# EasyEDA Pro project ProPrj_trevorschirmer-relayboard_2025-04-09.epro, board PCB_3
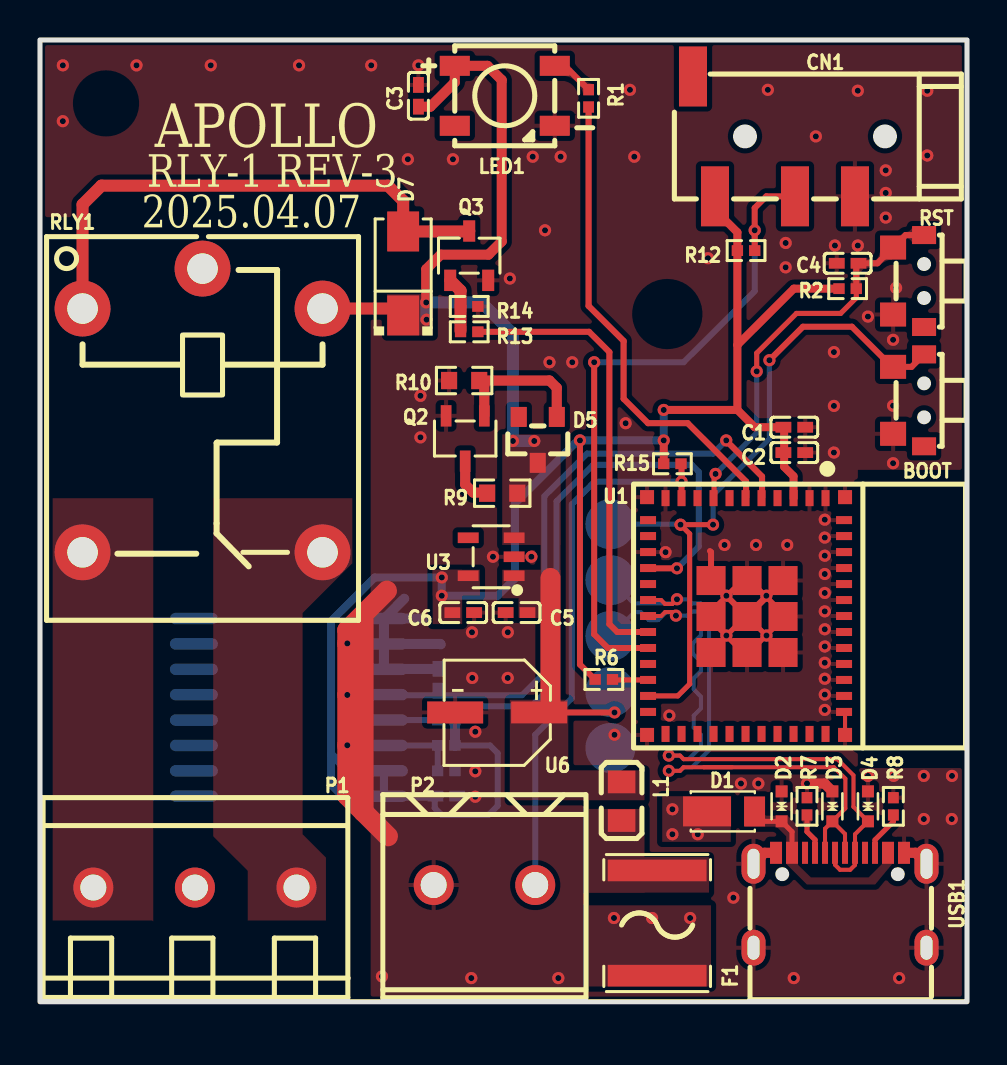
[diagram p8: board, top side]
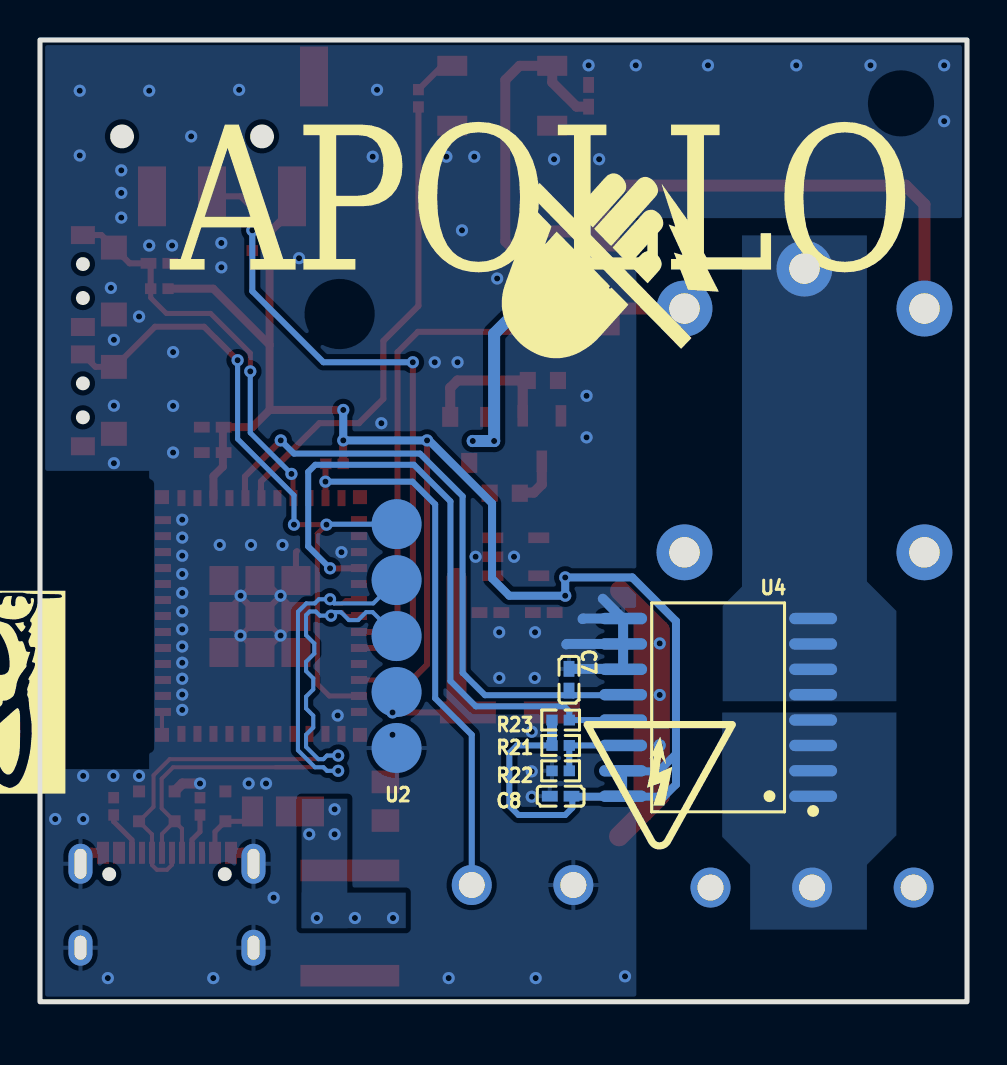
[diagram p9: board, bottom side, seen from below]

Outline 46.36 x 48.13 mm; copper layers: Top Layer, Bottom Layer. Coordinates in mm from the lower left corner of the outline.
Outline path: rectangle 0,48.13 46.36,0
Stack: Top Layer 0.07mm / Dielectric1 1.44mm FR4 er 4.5 / Bottom Layer 0.07mm

## Design rules (mm)
net IO_USBD-: DP1
net IO_USBD+: DP1
template: Custom Config
spacing copperThickness1oz: track to track 0.102, other pairs 0.152 to 0.3
spacing copperThickness2oz (default): track to track 0.203, other pairs 0.152 to 0.3
track width copperThickness1oz: min 0.127, default 0.254, max 7.2
track width copperThickness2oz (default): min 0.2, default 0.254, max 4
differential pair differentialPair (default): width min 0.127, default 0.254, max 2.54; gap min 0.152, default 0.152
via viaSize (default): diameter min 0.5, default 0.61, max 10; hole min 0.3, default 0.305, max 6.3

## Placement (name value [footprint] x y rotation side)
BOOT  TS24CA  [SW-SMD_TS24CA]  43.43 30.1 270 top
C1  10uF  [C0402]  37.72 28.75 180 top
C2  100nF  [C0402]  37.72 27.48 0 top
C3  100nF  [C0402]  18.92 45.34 270 top
C4  1uF  [C0402]  40.39 36.96 0 top
C5  10uF  [C0402]  23.83 19.48 0 top
C6  10uF  [C0402]  21.16 19.48 180 top
C7  220pF  [C0402]  19.9 16.12 270 bottom
C8  100nF  [C0402]  20.32 10.29 0 bottom
CN1  PJ-320D  [AUDIO-SMD_PJ-320D]  36.7 43.31 270 top
D1  DFLS130L-7  [POWERDI-123_L2.8-W1.8-LS3.7-RD]  34.54 9.52 0 top
D2  LESD5D5.0CT1G  [SOD-523_L1.2-W0.8-LS1.6-BI]  37.08 9.78 90 top
D3  LESD5D5.0CT1G  [SOD-523_L1.2-W0.8-LS1.6-BI]  39.62 9.78 90 top
D4  LESD5D5.0CT1G  [SOD-523_L1.2-W0.8-LS1.6-BI]  41.4 9.78 90 top
D5  BZX84C6V8  [SOT-23_L2.9-W1.3-P1.90-LS2.4-BR]  24.89 28.12 90 top
D7  1N4007  [SMA_L4.3-W2.5-LS5.0-RD]  18.16 36.45 90 top
F1  SMD2018-050  [F2018]  30.86 3.94 270 top
L1  BLM21PG221SN1D  [L0805]  29.08 10.03 270 top
LED1  XL-5050RGBC-WS2812B  [LED-SMD_4P-L5.0-W5.0-BL_XL-5050RGBC]  23.24 45.34 270 top
P1  WJ500V-5.08-3P  [CONN-TH_3P-P5.00_WJ500V-5.08-3P]  7.75 5.71 0 top
P2  WJ500V-5.08-2P  [CONN-TH_2P-P5.00_WJ500V-5.08-2P]  22.23 5.84 180 top
Q2  BC817  [SOT-23-3_L2.9-W1.4-P1.91-LS2.6-BR]  21.26 28.19 90 top
Q3  S8050-J3Y  [SOT-23-3_L2.9-W1.6-P1.90-LS2.8-BR]  21.46 37.34 270 top
R1  470Ω  [R0402]  27.43 45.21 270 top
R2  10kΩ  [R0402]  40.39 35.69 180 top
R6  10kΩ  [R0402]  28.19 16.13 180 top
R7  5.1kΩ  [R0402]  38.35 9.78 270 top
R8  5.1kΩ  [R0402]  42.67 9.78 270 top
R9  10K  [R0603]  23.11 25.45 0 top
R10  10K  [R0603]  21.21 31.09 0 top
R12  4.7kΩ  [R0402]  35.31 37.59 180 top
R13  470Ω  [R0402]  21.46 33.53 180 top
R14  10kΩ  [R0402]  21.46 34.8 180 top
R15  10kΩ  [R0402]  31.62 26.92 180 top
R21  6.8kΩ  [R0402]  20.32 12.83 0 bottom
R22  1kΩ  [R0402]  20.32 11.56 180 bottom
R23  10kΩ  [R0402]  20.32 14.1 0 bottom
RLY1  SRD-05VDC-SL-C  [RELAY-TH_SRD-XXVDC-XL-C]  8.13 29.59 270 top
RST  TS24CA  [SW-SMD_TS24CA]  43.43 36.07 270 top
U1  ESP32-C6-MINI-1-N4  [WIFIM-SMD_61P-L16.6-W13.2-P0.80-ESP32-C6-MINI-1-N4]  35.31 19.3 270 top
U2  -  [Programming Pads]  28.52 12.7 0 bottom
U3  RT9080-33GJ5  [TSOT-23-5_L2.9-W1.6-P0.95-LS2.8-BL]  22.56 22.27 90 top
U4  ACS733KLATR-40AB-T  [SOIC-16_L10.3-W7.5-P1.27-LS10.3-BL]  12.45 14.73 90 bottom
U6  100uF  [CAP-SMD_BD5.0-L5.3-W5.3-LS6.0-FD]  22.86 14.48 180 top
USB1  TYPE-C16PIN2MD(073)  [USB-C-SMD_TYPE-C-6PIN-2MD-073]  40.01 5.08 0 top

## Footprints (pads in the part's own frame, mm; a bottom-side part is the same pattern mirrored in y, then rotated)
AUDIO-SMD_PJ-320D
  rect 3x1.4 smd: 1(-3,-4.05) 2(3,4.05) 3(3,1.05) 4(3,-2.95)
C0402
  rect 0.79x0.54 smd: 1(-0.545,0) 2(0.545,0)
CAP-SMD_BD5.0-L5.3-W5.3-LS6.0-FD
  rect 2.8x1.1 smd: 1(-2.1,0) 2(2.1,0)
CONN-TH_2P-P5.00_WJ500V-5.08-2P
  round 2 hole 1.3: 1(-2.54,0) 2(2.54,0)
CONN-TH_3P-P5.00_WJ500V-5.08-3P
  round 2 hole 1.3: 1(-5.08,0) 2(0,0) 3(5.08,0)
F2018
  rect 1.083x4.941 smd: 1(-2.632,0) 2(2.632,0)
L0805
  rect 1.133x1.377 smd: 1(-0.966,0) 2(0.966,0)
LED-SMD_4P-L5.0-W5.0-BL_XL-5050RGBC
  rect 1x1.5 smd: 1(-1.5,-2.5) 2(1.5,-2.5) 3(1.5,2.5) 4(-1.5,2.5)
POWERDI-123_L2.8-W1.8-LS3.7-RD
  rect 2.4x1.5 smd: 1(-1.188,0)
  rect 1.05x1.5 smd: 2(1.188,0)
Programming Pads
  round 2.5 smd: 1(0,0) 2(0,-2.8) 3(0,-5.6) 4(0,-8.4) 5(0,-11.2)
R0402
  rect 0.566x0.54 smd: 1(-0.433,0) 2(0.433,0)
R0603
  rect 0.806x0.864 smd: 1(-0.753,0) 2(0.753,0)
RELAY-TH_SRD-XXVDC-XL-C
  round 2.794 hole 1.524: 1(-5.1,-6) 2(7.1,-6) 3(7.1,6) 4(-5.1,6) 5(-7.1,0)
SMA_L4.3-W2.5-LS5.0-RD
  rect 2x1.593 smd: 1(-2.1,0) 2(2.1,0)
SOD-523_L1.2-W0.8-LS1.6-BI
  rect 0.6x0.6 smd: 1(-0.75,0) 2(0.75,0)
SOIC-16_L10.3-W7.5-P1.27-LS10.3-BL
  oval 0.574x2.401 smd: 1(-4.445,-4.75) 2(-3.175,-4.75) 3(-1.905,-4.75) 4(-0.635,-4.75) 5(0.635,-4.75) 6(1.905,-4.75) 7(3.175,-4.75) 8(4.445,-4.75) 9(4.445,4.75) 10(3.175,4.75) 11(1.905,4.75) 12(0.635,4.75) 13(-0.635,4.75) 14(-1.905,4.75) 15(-3.175,4.75) 16(-4.445,4.75)
SOT-23-3_L2.9-W1.4-P1.91-LS2.6-BR
  rect 1.07x0.532 smd: 1(1.135,-0.955) 2(1.135,0.955) 3(-1.135,0)
SOT-23-3_L2.9-W1.6-P1.90-LS2.8-BR
  rect 1.07x0.6 smd: 1(1.235,-0.95) 2(1.235,0.95) 3(-1.235,0)
SOT-23_L2.9-W1.3-P1.90-LS2.4-BR
  rect 1x0.8 smd: 1(1.15,-0.95) 2(1.15,0.95) 3(-1.15,0)
SW-SMD_TS24CA
  rect 0.9x1.2 smd: 1(-2.3,0.775) 2(2.3,0.775)
  rect 1.2x1.3 smd: 3(-1.675,-0.775) 4(1.675,-0.775)
TSOT-23-5_L2.9-W1.6-P0.95-LS2.8-BL
  rect 0.532x1.045 smd: 1(-0.95,-1.147) 2(0,-1.147) 3(0.95,-1.147) 4(0.95,1.147) 5(-0.95,1.147)
USB-C-SMD_TYPE-C-6PIN-2MD-073
  rect 0.6x1.1 smd: 1(-3.2,2.375) 2(-2.4,2.375) 11(2.4,2.375) 12(3.2,2.375)
  rect 0.3x1.1 smd: 3(-1.75,2.375) 4(-1.25,2.375) 5(-0.75,2.375) 6(-0.25,2.375) 7(0.25,2.375) 8(0.75,2.375) 9(1.25,2.375) 10(1.75,2.375)
  oval 1.2x2 hole 0.6x1.5: 13(-4.325,1.825) 14(4.325,1.825)
  oval 1.2x1.8 hole 0.6x1.2: 13(-4.325,-2.375) 14(4.325,-2.375)
WIFIM-SMD_61P-L16.6-W13.2-P0.80-ESP32-C6-MINI-1-N4
  rect 0.8x0.4 smd: 1(-5.9,3.975) 2(-5.9,3.175) 3(-5.9,2.375) 4(-5.9,1.575) 5(-5.9,0.775) 6(-5.9,-0.025) 7(-5.9,-0.825) 8(-5.9,-1.625) 9(-5.9,-2.425) 10(-5.9,-3.225) 11(-5.9,-4.025) 25(5.9,-4.025) 26(5.9,-3.225) 27(5.9,-2.425) 28(5.9,-1.625) 29(5.9,-0.825) 30(5.9,-0.025) 31(5.9,0.775) 32(5.9,1.575) 33(5.9,2.375) 34(5.9,3.175) 35(5.9,3.975)
  rect 0.4x0.8 smd: 12(-4.8,-4.9) 13(-4,-4.9) 14(-3.2,-4.9) 15(-2.4,-4.9) 16(-1.6,-4.9) 17(-0.8,-4.9) 18(0,-4.9) 19(0.8,-4.9) 20(1.6,-4.9) 21(2.4,-4.9) 22(3.2,-4.9) 23(4,-4.9) 24(4.8,-4.9) 36(4.8,4.9) 37(4,4.9) 38(3.2,4.9) 39(2.4,4.9) 40(1.6,4.9) 41(0.8,4.9) 42(0,4.9) 43(-0.8,4.9) 44(-1.6,4.9) 45(-2.4,4.9) 46(-3.2,4.9) 47(-4,4.9) 48(-4.8,4.9)
  rect 1.45x1.45 smd: 49(-1.775,1.85) 49(-1.775,0.05) 49(-1.775,-1.75) 49(0.025,1.85) 49(0.025,0.05) 49(0.025,-1.75) 49(1.825,1.85) 49(1.825,0.05) 49(1.825,-1.75)
  rect 0.7x0.7 smd: 50(5.95,4.95) 51(5.95,-4.95) 52(-5.95,-4.95) 53(-5.95,4.95)

## Nets
As in the schematic.

Pads without a net: BOOT 2; CN1 1; D5 2; LED1 2; RST 2; U1 4 7 9 12 13 16 21 24 25 26 27 28 29 30 31 32 33 34 35; U3 4; USB1 3 9

## Via types
v1: diameter 0.61, hole 0.305, Top Layer to Bottom Layer, 120 vias

## Routing (per net, layer and track width the routed paths; a pad name or vN(x,y) marks a point on that pad's centre or on a via; arc(x,y) is an arc through that point)
+3V3: length 94.6
  Top Layer w0.3: R6.2 27.75,16.13 27,16.88 v1(27,28.09)
  Top Layer w0.4: R2.2 37.69,35.69 34.87,32.87 ; 34.87,29.62 31.22,29.62 ; 34.87,29.62 34.87,32.87 ; 34.87,29.62 35.74,28.75 37.17,28.75 37.21,28.72 37.21,26.77 37.68,26.3 U1.3 ; 34.87,32.87 34.87,38.51 33.75,39.63 CN1.4 ; R15.2 v1(31.19,28.09)
  Bottom Layer w0.3: R21.2 22.5,12.83 22.89,12.45 22.89,9.8 22.43,9.35 20.09,9.35 19.74,9.7 19.74,10.25
  Bottom Layer w0.4: 14.55,12.4 14.55,10.87 15.16,10.26 17.17,10.26 ; 14.55,12.4 15.42,11.53 17.17,11.53 17.2,11.56 U4.16 17.17,10.26 ; 14.55,12.4 14.55,19.05 16.74,21.23 v1(20.09,21.23) v1(20.09,20.32) 22.89,20.32 23.75,21.18 23.75,24.94 26.9,28.09 v1(31.19,28.09) 31.19,29.59 31.22,29.62 ; 17.17,10.26 19.75,10.26 C8.1
  Bottom Layer w0.5: R23.2 R21.2
  vias: v1(31.19,29.62)
+5V_USB: length 47.9
  Top Layer w0.3: 25.53,14.48 v1(28.73,14.48)
  Top Layer w0.5: v1(19.31,35) 19.31,36.66 20.04,37.39 22.43,37.39 23.09,38.05 23.09,46.13 22.38,46.84 LED1.1 20.74,46.01 19.52,44.79 C3.2
  Top Layer w0.6: RLY1.4 17.82,34.69 18.16,34.35
  Top Layer w1: 25.53,21.21 25.53,14.48 U6.1
  Bottom Layer w0.3: v1(28.73,14.48) 28.73,15.3 U2.2
  Bottom Layer w0.6: v1(24.71,28.06) v1(23.65,28.06) 23.65,33.43 22.08,35 v1(19.31,35) 19.31,34.15 v1(19.33,34.14)
GND: length 66.9
  Top Layer w0.203: U1.36 40.26,14.45 U1.50
  Top Layer w0.254: 35.31,19.3 36.29,20.29 ; 35.31,19.3 34.32,18.32 ; 35.31,19.3 35.31,19.34 ; 37.28,17.33 37.28,17.36 36.31,18.33 ; 36.31,18.33 37.28,19.3 36.29,20.29 ; 36.31,18.33 35.36,19.28 ; 36.31,18.33 35.31,17.33 34.32,18.32 ; 36.29,20.29 35.31,21.28 34.35,20.32 v1(34.32,20.32) 34.32,20.3 33.33,19.3 34.32,18.32 ; 36.29,20.29 v1(36.32,20.32) 37.28,21.28 ; 34.32,18.32 33.33,17.33 ; 33.33,21.28 33.36,21.28 33.56,21.09
  Top Layer w0.3: 33.5,22.55 33.56,22.5 U1.49 34.32,20.31 35.31,19.33 35.32,19.32 35.36,19.28 35.36,19.28 U1.49
  Top Layer w0.508: USB1.1 36.23,7.45 USB1.13 ; USB1.12 43.78,7.45 USB1.14 ; D3.2 39.23,10.92 v1(38.35,10.92)
  Top Layer w1: 17.35,20.57 15.37,18.59 v1(15.37,17.93) v1(15.37,15.35) v1(15.37,12.83) 15.37,10.31 16.18,9.5 ; 16.18,9.5 16.18,19.1 ; 16.18,9.5 17.4,8.28
  Bottom Layer w0.5: U4.10 U4.9 17.22,19.18 ; U4.10 U4.11 17.22,16.66 C7.1 ; U4.10 20.02,17.91 20.04,17.88 ; 17.22,19.18 18.21,20.17 ; 17.22,19.18 19.2,19.18 19.23,19.15
  vias: v1(1.14,46.86) v1(1.14,44.07) v1(4.83,46.86) v1(8.54,46.86) v1(12.95,46.86) v1(16.56,46.86) v1(17.1,1.27) v1(18.4,42.16) v1(18.92,46.86) v1(19.02,30.32) v1(19.02,28.24) v1(20.65,42.16) v1(21.57,1.18) v1(21.6,18.49) v1(21.62,16.2) v1(21.77,13.51) v1(21.77,11.53) v1(21.77,10.26) v1(22.65,22.27) v1(23.39,16.2) v1(23.39,18.49) v1(23.49,36.19) v1(24.57,22.27) v1(24.64,42.29) v1(25.25,38.61) v1(25.48,32) v1(25.92,1.18) v1(26.04,42.29) v1(26.62,32) v1(28.73,13.36) v1(29.29,28.95) v1(29.5,45.64) v1(29.72,42.29) v1(31.28,22.5) v1(31.47,14.33) v1(33.4,37.21) v1(34.23,22.86) v1(34.32,18.33) v1(34.67,5.21) v1(35.05,10.92) v1(35.8,22.86) v1(35.92,10.92) v1(36.33,18.33) v1(36.4,45.64) v1(37.29,37.97) v1(37.29,36.75) v1(37.37,22.86) v1(37.69,1.18) v1(38.8,43.31) v1(39.24,24.13) v1(39.24,23.23) v1(39.24,22.32) v1(39.24,21.41) v1(39.24,20.46) v1(39.24,19.54) v1(39.24,18.64) v1(39.24,17.78) v1(39.24,16.97) v1(39.24,16.17) v1(39.24,15.37) v1(39.24,14.6) v1(39.75,37.85) v1(39.7,32.51) v1(39.7,29.82) v1(39.7,27.48) v1(40.89,45.59) v1(40.89,37.85) v1(41.4,34.29) v1(41.4,11.3) v1(42.29,41.61) v1(42.29,40.48) v1(42.29,39.24) v1(42.66,33.13) v1(42.66,29.83) v1(42.66,26.95) v1(42.69,11.3) v1(42.81,35.73) v1(42.96,1.18) v1(44.2,11.3) v1(44.2,9.14) v1(44.37,45.59) v1(44.37,42.35) v1(45.6,11.3) v1(45.59,9.14)
CHIP_PU: length 19.9
  Top Layer w0.254: v1(33.78,26.42) 33.71,26.34 33.71,25.2 ; v1(35.84,31.55) 35.84,32.46 37.83,34.45 40.04,34.45 40.82,35.23 R2.1
  Top Layer w0.305: RST.1 43.28,38.37 RST.3 41.87,36.96 C4.2 40.82,36.84 R2.1
  Bottom Layer w0.254: v1(33.78,26.42) 35.84,28.47 v1(35.84,31.55)
FAULT_CUR: length 33.4
  Top Layer w0.3: U1.15 30.42,21.69 v1(31.85,21.69)
  Bottom Layer w0.3: v1(31.85,21.69) 32.94,22.78 32.94,26.52 32.59,26.87 27.66,26.87 25.83,25.04 25.83,16.05 24.56,14.78 20.14,14.78 19.89,14.53 R23.1 U4.13
IO_4_RELAY: length 22.7
  Top Layer w0.3: U1.19 28.87,18.5 28.47,18.9 28.47,32.51 27.46,33.53 R13.1
IO_5_TEMP: length 33.5
  Top Layer w0.3: CN1.3 36.32,40.31 35.74,39.73 R12.1 ; U1.20 28.4,17.7 27.71,18.39 v1(27.71,32)
  Bottom Layer w0.3: v1(27.71,32) 32.18,32 35.74,35.56 v1(35.74,38.61)
IO_10_LIMIT: length 27.5
  Top Layer w0.3: R15.1 32.08,26.9 v1(32.08,26.03) U1.10
  Bottom Layer w0.3: P2.1 24.77,13.36 26.59,15.19 26.59,24.89 27.73,26.03 v1(32.08,26.03)
IO_BTN1: length 34.8
  Top Layer w0.254: U1.23 31.89,15.3 32.49,15.9 32.49,23.42 v1(32.03,23.88) v1(33.65,23.88)
  Top Layer w0.3: 44.21,32.4 43.58,31.77 BOOT.3 42.61,31.77 40.6,33.78 38.15,33.78 v1(36.47,32.11)
  Top Layer w0.305: 32.03,23.72 31.88,23.88
  Bottom Layer w0.254: U2.5 31.85,23.9 ; v1(36.47,32.11) 36.47,28.17 33.65,25.35 v1(33.65,23.88)
  Bottom Layer w0.3: v1(32.03,23.88) 32.01,23.9 31.85,23.9 31.88,23.88
IO_LED: length 24
  Top Layer w0.305: 35.31,25.2 35.31,26.03 32.39,28.96 30.4,28.96 29.18,30.17 29.18,33.07 27.43,34.82 27.43,44.78
IO_USBD+: length 33.1
  Top Layer w0.203: v1(31.8,19.32) 31.62,19.5 31.26,19.5 31.06,19.3 U1.18 ; USB1.6 39.76,6.85 40.01,6.6 40.51,6.6 40.76,6.85 USB1.8 40.76,8.38 D4.1 40.68,9.75 40.68,11.33 39.87,12.14 32.18,12.14 32,12.32 v1(31.45,12.32)
  Bottom Layer w0.203: U2.3 29.72,19.5 30.05,19.5 30.45,19.1 30.91,19.1 31.31,19.5 31.63,19.5 v1(31.8,19.32) 32.36,19.32 32.57,19.53 32.87,19.53 33.05,19.35 33.05,18.34 32.64,17.93 32.64,17.42 33.05,17.01 33.05,16.55 32.69,16.19 32.69,15.63 33.05,15.27 33.05,14.68 32.69,14.32 32.69,13.72 33.05,13.36 33.05,12.76 32.44,12.14 32.18,12.14 32,12.32 v1(31.45,12.32)
IO_USBD-: length 33.3
  Top Layer w0.203: 34.6,11.73 33.2,11.73 ; 33.2,11.73 32.18,11.73 32,11.56 v1(31.45,11.56) ; 33.2,11.73 39.7,11.73 40.27,11.16 40.27,9.68 D3.1 ; USB1.5 39.26,8.66 D3.1 ; USB1.7 40.26,8.4 D3.1 ; U1.17 31.06,20.1 31.26,19.91 31.62,19.91 31.85,20.14 v1(31.85,20.14)
  Bottom Layer w0.203: U2.4 29.69,19.94 31.65,19.94 v1(31.85,20.14) 32.41,20.14 32.62,19.94 33.04,19.94 33.46,19.52 33.46,12.59 32.6,11.73 32.18,11.73 32,11.56 v1(31.45,11.56)
  Bottom Layer w0.254: v1(31.85,20.14) 31.8,20.14
OUT_CUR: length 31.6
  Top Layer w0.305: v1(34.32,28.09) 34.32,28.08 36.11,26.28 36.11,25.2
  Bottom Layer w0.3: v1(34.32,28.09) 33.65,27.43 27.36,27.43 25.22,25.3 25.22,16.46 24.1,15.34 19.68,15.34 ; 19.68,15.34 19.9,15.56 19.9,15.62 ; 19.68,15.34 17.22,15.34 U4.12
$1N1788: length 2.1
  Top Layer w0.254: R7.2 38.35,8.51 38.76,8.11 USB1.4
$1N1789: length 2.3
  Top Layer w0.254: R8.2 42.67,9.02 41.76,8.1 USB1.10
$1N1792: length 1.9
  Top Layer w0.508: 21.26,26.49 21.26,25.88 21.67,25.48 22.36,25.48
$1N1794: length 7.4
  Top Layer w0.508: Q2.1 22.22,30.83 R10.2 25.48,31.09 25.84,30.72 D5.1
$1N1837: length 2.2
  Top Layer w0.305: LED1.4 26.24,46.84 R1.1
$1N1854: length 3.5
  Top Layer w0.254: USB1.2 37.61,8.51 D2.1 35.95,9.03 35.73,9.25 D1.2
$1N8479: length 1.8
  Top Layer w0.254: U1.22 28.65,16.1 R6.1
$1N10954:
  vias: v1(28.7,4.19) v1(30.61,4.19) v1(31.62,9.63) v1(31.62,8.38) v1(32.51,4.19) v1(32.89,8.38)
$2N930: length 2.7
  Top Layer w0.6: 21.03,33.59 21.03,35.59 Q3.1
$2N1031: length 26.8
  Top Layer w0.6: RLY1.1 2.13,39.9 3.07,40.84 17.4,40.84 18.16,40.08 D7.2 21.44,38.55 Q3.3
$2N4158: length 4
  Bottom Layer w0.3: R22.2 R21.1 U4.14

## Copper pours and planes (outline as drawn; the poured copper is in the pictures)
+3V3 on Top Layer: 19.63,21.62 21.11,21.62 21.11,18.9 19.63,18.9
+3V3 on Top Layer: 19.63,21.62 22,21.62 22,20.32 19.63,20.32
+5V_USB on Top Layer: 23.49,15.11 26.42,15.11 26.42,10.29 23.49,10.29
+5V_USB on Top Layer: 23.11,21.62 26.04,21.62 26.04,20.19 23.11,20.19
+5V_USB on Top Layer: 23.93,21.59 26.04,21.59 26.04,19.21 23.93,19.21
+5V_USB on Top Layer: 23.49,11.58 30.23,11.58 30.23,10.08 23.49,10.08
+5V_USB on Top Layer: 25.03,25.4 26.04,25.4 26.04,19.48 25.03,19.48
+5V_USB on Top Layer: 23.11,28.4 26.04,28.4 26.04,22.86 23.11,22.86
+5V_USB on Top Layer: 17.35,35.41 19.64,35.41 19.64,33.34 17.35,33.34
GND on Top Layer: 0,48.16 0,39.29 -0.03,39.27 16.54,39.27 16.54,0 46.36,0 46.36,11.7 40.9,11.7 40.9,26.62 46.38,26.62 46.38,48.16
GND on Bottom Layer: 0,48.11 0,39.24 -0.03,39.22 16.54,39.22 16.54,-0.05 46.36,-0.05 46.36,11.65 40.9,11.65 40.9,26.57 46.38,26.57 46.38,48.16
COM on Bottom Layer: 3.53,38.35 12.22,38.35 12.22,15.04 3.53,15.04
COM# on Bottom Layer: 3.53,14.48 12.24,14.48 12.24,3.61 3.53,3.61
NC on Top Layer: 8.66,25.2 15.62,25.2 15.62,4.06 8.66,4.06
NO on Top Layer: 0.64,25.2 5.66,25.2 5.66,4.01 0.64,4.01
$1N1854 on Top Layer: 35.24,10.23 42.67,10.23 42.67,5.86 35.24,5.86
$1N10954 on Top Layer: 31.11,10.29 34.54,10.29 34.54,8 31.11,8
$1N10954 on Top Layer: 27.43,4.83 33.55,4.83 33.55,0.76 27.43,0.76
$1N10954 on Bottom Layer: 30.99,10.16 33.27,10.16 33.27,3.68 30.99,3.68
$1N10954 on Bottom Layer: 28.07,5.46 33.27,5.46 33.27,3.68 28.07,3.68
$1N10962 on Top Layer: 27.43,9.65 30.23,9.65 30.23,5.46 27.43,5.46
$1N10962 on Top Layer: 27.43,7.24 33.45,7.24 33.45,5.46 27.43,5.46

Small or netless copper shapes (teardrops, artwork), in the pictures only: 15 on Top Layer

## Text on the board
Bottom Silkscreen Layer: APOLLO
Top Silkscreen Layer: 2025.04.07 | RLY-1 REV-3 | APOLLO
